# Altium schematic sheet S3_PowSwitch.SchDoc
size 420 x 297 mm; SheetNumber: 3; SheetTotal: 7
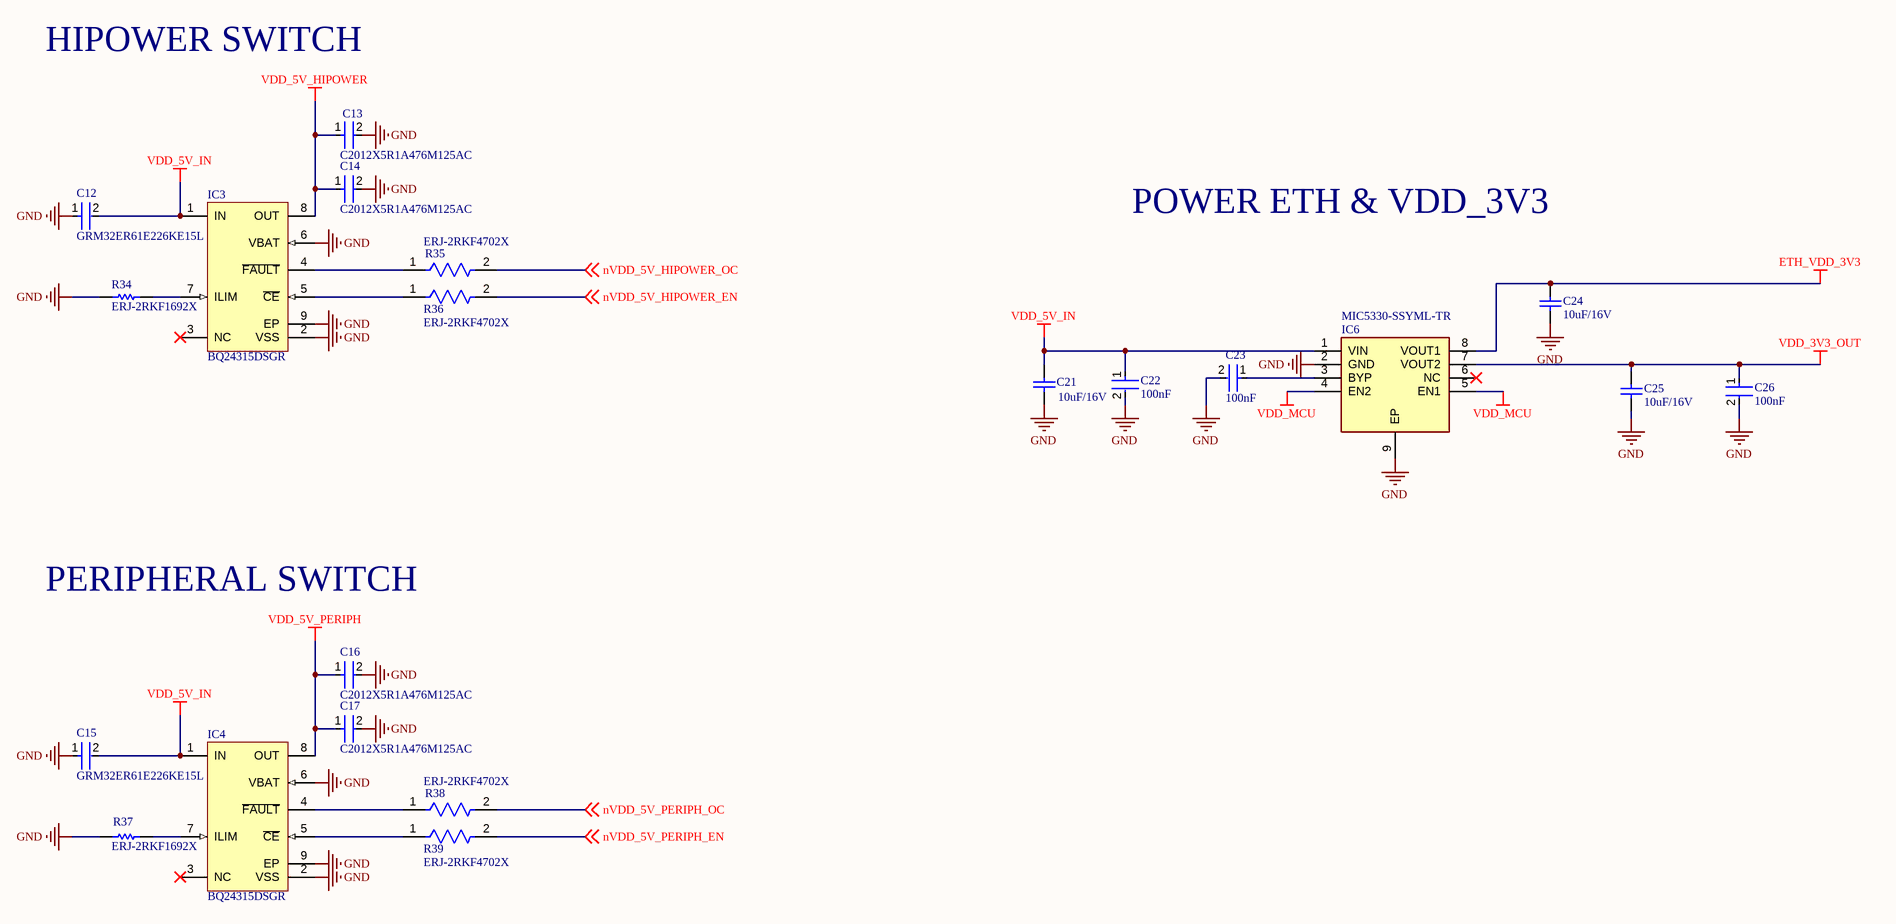
[diagram p0: S3_PowSwitch.SchDoc]

## Parts
C12  GRM32ER61E226KE15L  [FP-GRM32-MFG]
C13  C2012X5R1A476M125AC  [FP-C2012-125-0_2-IPC_B]
C14  C2012X5R1A476M125AC  [FP-C2012-125-0_2-IPC_B]
C15  GRM32ER61E226KE15L  [FP-GRM32-MFG]
C16  C2012X5R1A476M125AC  [FP-C2012-125-0_2-IPC_B]
C17  C2012X5R1A476M125AC  [FP-C2012-125-0_2-IPC_B]
C21  10uF/16V  [CAPC1210(3225)210_L]
C22  100nF  [FP-CC0402-MFG]
C23  100nF  [FP-CC0402-MFG]
C24  10uF/16V  [CAPC1210(3225)210_L]
C25  10uF/16V  [CAPC1210(3225)210_L]
C26  100nF  [FP-CC0402-MFG]
IC3  BQ24315DSGR  [DSG0008A_V]
IC4  BQ24315DSGR  [DSG0008A_V]
IC6  MIC5330-SSYML-TR  [SON50P200X200X95-9N-D]
R34  ERJ-2RKF1692X  [RESC1005X40X25ML05T05]
R35  ERJ-2RKF4702X  [FP-ERJ2RK-IPC_B]
R36  ERJ-2RKF4702X  [FP-ERJ2RK-IPC_B]
R37  ERJ-2RKF1692X  [RESC1005X40X25ML05T05]
R38  ERJ-2RKF4702X  [FP-ERJ2RK-IPC_B]
R39  ERJ-2RKF4702X  [FP-ERJ2RK-IPC_B]

## Nets
ETH_VDD_3V3: C24.2 IC6.8(VOUT1)
GND: C12.1 C13.2 C14.2 C15.1 C16.2 C17.2 C21.1 C22.2 C23.2 C24.1 C25.1 C26.2 IC3.2(VSS) IC3.6(VBAT) IC3.9(EP) IC4.2(VSS) IC4.6(VBAT) IC4.9(EP) IC6.2(GND) IC6.9(EP) R34.1 R37.1
VDD_3V3_OUT: C25.2 C26.1 IC6.7(VOUT2)
VDD_5V_HIPOWER: C13.1 C14.1 IC3.8(OUT)
VDD_5V_IN: C12.2 C15.2 C21.2 C22.1 IC3.1(IN) IC4.1(IN) IC6.1(VIN)
VDD_5V_PERIPH: C16.1 C17.1 IC4.8(OUT)
VDD_MCU: IC6.4(EN2) IC6.5(EN1)
nVDD_5V_HIPOWER_EN: R36.2 ; off-sheet nVDD_5V_HIPOWER_EN
nVDD_5V_HIPOWER_OC: R35.2 ; off-sheet nVDD_5V_HIPOWER_OC
nVDD_5V_PERIPH_EN: R39.2 ; off-sheet nVDD_5V_PERIPH_EN
nVDD_5V_PERIPH_OC: R38.2 ; off-sheet nVDD_5V_PERIPH_OC
NetC23_1: C23.1 IC6.3(BYP)
NetIC3_4: IC3.4(~{FAULT}) R35.1
NetIC3_5: IC3.5(~{CE}) R36.1
NetIC3_7: IC3.7(ILIM) R34.2
NetIC4_4: IC4.4(~{FAULT}) R38.1
NetIC4_5: IC4.5(~{CE}) R39.1
NetIC4_7: IC4.7(ILIM) R37.2

Not connected (* = marked no-connect by the designer): IC3 3(NC)*; IC4 3(NC)*; IC6 6(NC)*

## Notes on the sheet
- HIPOWER SWITCH
- POWER ETH & VDD_3V3
- PERIPHERAL SWITCH
- THIS DOCUMENT AND THE DATA DISCLOSED HEREIN OR
- HEREWITH IS THE PROPERTY OF ALTIUM LIMITED AND MAY
- DWG NO:
- REVISION
- REV:
- DESCRIPTION
- DATE
- APPROVED
- BE FREELY DISTRIBUTED IN WHOLE. NO RIGHTS ARE
- RESERVED OR EXPRESS OR IMPLIED WARANTEE GIVEN.
- ENG:
- APPROVALS
- PROJECT
- DSN:
- CHK:
- REFERENCE DOCUMENTS
- PROJECT REVISION:
- TITLE
- DOCUMENT REVISION:
- DESIGN ITEM:
- BOM:
- FAB DWG:
- PCB DWG:
- ASSY DWG:
- SCALE:
- A3
- SIZE
- CAGE CODE
- FILE NAME
- DWG NO.
- SHEET
- OF
- REV

## Library data of the parts
C12 C15 = CMP-2000-05458-2: CAP CER 22UF 25V X5R 1210; Manufacturer: Murata Electronics North America; Possible Substitute: GRM32ER61E226KE15K; Other Names: 490-3889-2; Material: Ceramic; Tolerance: 10%; Digikey Description: CAP CER 22UF 25V X5R 1210; Mouser Description: Multilayer Ceramic Capacitors MLCC - SMD/SMT 1210 22uF 25volts X5R 10%; Device Class L2: Capacitors; Height: 2.7mm; Temperature Characteristic: X5R; Category: Cap; RoHS: TRUE; Operating Temperature: -55°C ~ 85°C; Temperature: -55°C to +85°C; Lead Free: Yes; Package: GRM32; Temperature Range High: +85°C; Package / Case: 1210 (3225 Metric); Standard Package: 1,000; Packaging: Cut Tape (CT); Capacitance: 22uF; Thickness (Max): 0.106" (2.70mm); Value: 22uF; Automotive: No; Device Class L1: Passive Components; Voltage - Rated: 25V; Temperature Range Low: -55°C; Size / Dimension: 0.126" L x 0.098" W (3.20mm x 2.50mm); ComponentLink2Description: Datasheet; Device Class L3: Ceramic Capacitors; Temperature Coefficient: X5R; ComponentLink2URL: https://search.murata.co.jp/Ceramy/image/img/A01X/G101/ENG/GRM32ER61E226KE15-01A.pdf; Voltage Rating: 25V; Manufacturer Part Number: GRM32ER61E226KE15L; Octopart: https://octopart.com/grm32er61e226ke15l-murata-197441; Applications: General Purpose; Mounting Type: Surface Mount, MLCC
C13 C14 C16 C17 = CMP-2000-05451-2: Multilayer Ceramic Capacitors 47μF ±20% 10V X5R SMD 0805; Capacitance: 47uF; RoHS Compliant: Yes; Dielectric: X5R; Case Code (Imperial): 0805; Min Operating Temperature: -55°C; Length: 2mm; Voltage Rating: 10V; Lead Free: Lead Free; Weight: 0.000194oz; Resistor Type: Ceramic; Dielectric Material: Ceramic; Max Operating Temperature: 85°C; Height: 1.25mm; Width: 0.049inch; Depth: 1.25mm; Termination: SMD/SMT; Case/Package: 0805; Voltage Rating (DC): 10V; Voltage: 10V; Thickness: 0.057inch; Tolerance: 20%; REACH SVHC: No SVHC; Package Quantity: 1; Series: C; Case Code (Metric): 2012; Mount: Surface Mount; Packaging: Tape and Reel
C21 C24 C25 = CMP-1038-02215-1: CAP 10uF 16V ±20% 1210 (3225 Metric) Thickness 2.1mm SMD; Case-EIA: 1210; Tolerance: Â±20%; Case-Metric: 3225; Max Thickness: 2.1 mm; Rated Voltage: 16 V; Value: 10uF; Technology: SMT
C22 C23 C26 = CMP-03422-001121-1: CAP CER 0.1UF 16V X7R 0402; Manufacturer: YAGEO; Manufacturer Part Number: CC0402KPX7R7BB104; Material: Ceramic; Temperature Coefficient: 30ppm/°C; Automotive Grade: NA; Tolerance: 0.1; Digikey Description: CAP CER 0.1UF 16V X7R 0402; Temperature Range Low: -55°C; Footprint Url: http://www.yageo.com/exep/pages/download/literatures/UPY-C_GEN_24.pdf; RoHS: TRUE; Device Class L3: Ceramic Capacitors; Temperature Characteristic: X7R; Capacitance: 100 nF; Package: CC0402; Device Class L1: Passive Components; Lead Free: Yes; Temperature Range High: +125°C; Category: Cap; Mouser Description: 0402 0.1 uF 16 V ±10% Tolerance X7R SMT Multilayer Ceramic Capacitor; Voltage Rating: 16 V; Value: 100 nF; ComponentLink2Description: Datasheet; Automotive: No; Octopart: https://octopart.com/cc0402kpx7r7bb104-yageo-21548559; ComponentLink2URL: http://www.yageo.com/documents/recent/UPY-GP_NP0_16V-to-50V_16.pdf; Height: 0.55mm; Device Class L2: Capacitors; Temperature: -55°C to +125°C; Ipc Land Pattern Name: CAPC10050X50
IC3 IC4 = CMP-0321-00484-2: Overvoltage & Overcurrent Protection IC & Li+ Charger Front-End Protection IC, -40 to 125 degC, 8-pin WSON (DSG), Green (RoHS & no Sb/Br); Manufacturer: Texas Instruments; SubFamily: Charger Front End Protection; NiMH: N; PackageReference: DSG0008A; PackageVersion: revB, Oct-2010; Code_JEDEC: MO-229; DatasheetVersion: SLUS817A; NiCd: N; Over Voltage Protection: N; PackageDescription: 8-Pin Plastic Small Outline No-Lead, 2 x 2 x 0.8 mm Body, 0.5 mm Pitch, Exposed Pad; Eco-Plan: Green (RoHS & no Sb/Br); Lead Acid: N; ComponentLink1URL: http://www.ti.com/general/docs/lit/getliterature.tsp?genericPartNumber=BQ24315&fileType=pdf; ComponentLink1Description: Datasheet; Li-Ion: N; Mounting Technology: Surface Mount; Li-Polymer: N; PartNumber: BQ24315DSGR
IC6 = MIC5330-SSYML-TR: Integrated Circuit; Manufacturer_Name: Microchip; Datasheet Link: http://www.microchip.com/mymicrochip/filehandler.aspx?ddocname=en579824; Height: 0.95mm; Manufacturer_Part_Number: MIC5330-SSYML-TR; Mouser Part Number: 998-MIC5330-SSYMLTR; Mouser Price/Stock: https://www.mouser.co.uk/ProductDetail/Microchip-Technology/MIC5330-SSYML-TR?qs=U6T8BxXiZAVlV%252Bccuslf5g%3D%3D; Arrow Part Number: MIC5330-SSYML-TR; Arrow Price/Stock: https://www.arrow.com/en/products/mic5330-ssyml-tr/microchip-technology?region=nac
R34 R37 = CMP-1011-00647-2: Manufacturer: Panasonic; Part Number: ERJ-2RKF1692X
R35 R36 R38 R39 = CMP-2002-01155-2: RES SMD 47K OHM 1% 1/10W 0402; Resistance: 47kR; Voltage Rating: 50V; Power Rating: 100mW; Temperature Coefficient: 100ppm/°C; Contact Plating: Tin; Radiation Hardening: No; Case/Package: 0402; Length: 1mm; Termination: SMD/SMT; RoHS Compliant: Yes; Resistor Type: Thick Film; Voltage Rating (DC): 50V; Depth: 0.5mm; Series: ERJ; Construction: Rectangular; REACH SVHC: No SVHC; Min Operating Temperature: -55°C; Packaging: Tape and Reel; Max Power Dissipation: 100mW; Military Standard: Not; Package Quantity: 1; Resistance Tolerance: 1%; Case Code (Metric): 1005; Technology: THICK FILM; Height: 0.35mm; Max Operating Temperature: 155°C; Number of Pins: 2; Tolerance: 1%; Case Code (Imperial): 0402; Width: 0.5mm; Number of Terminations: 2; Mount: Surface Mount; Features: Automotive AEC-Q200; Lead Free: Lead Free